# Altium schematic sheet Ext_GPIO_Bank2.SchDoc
size A3
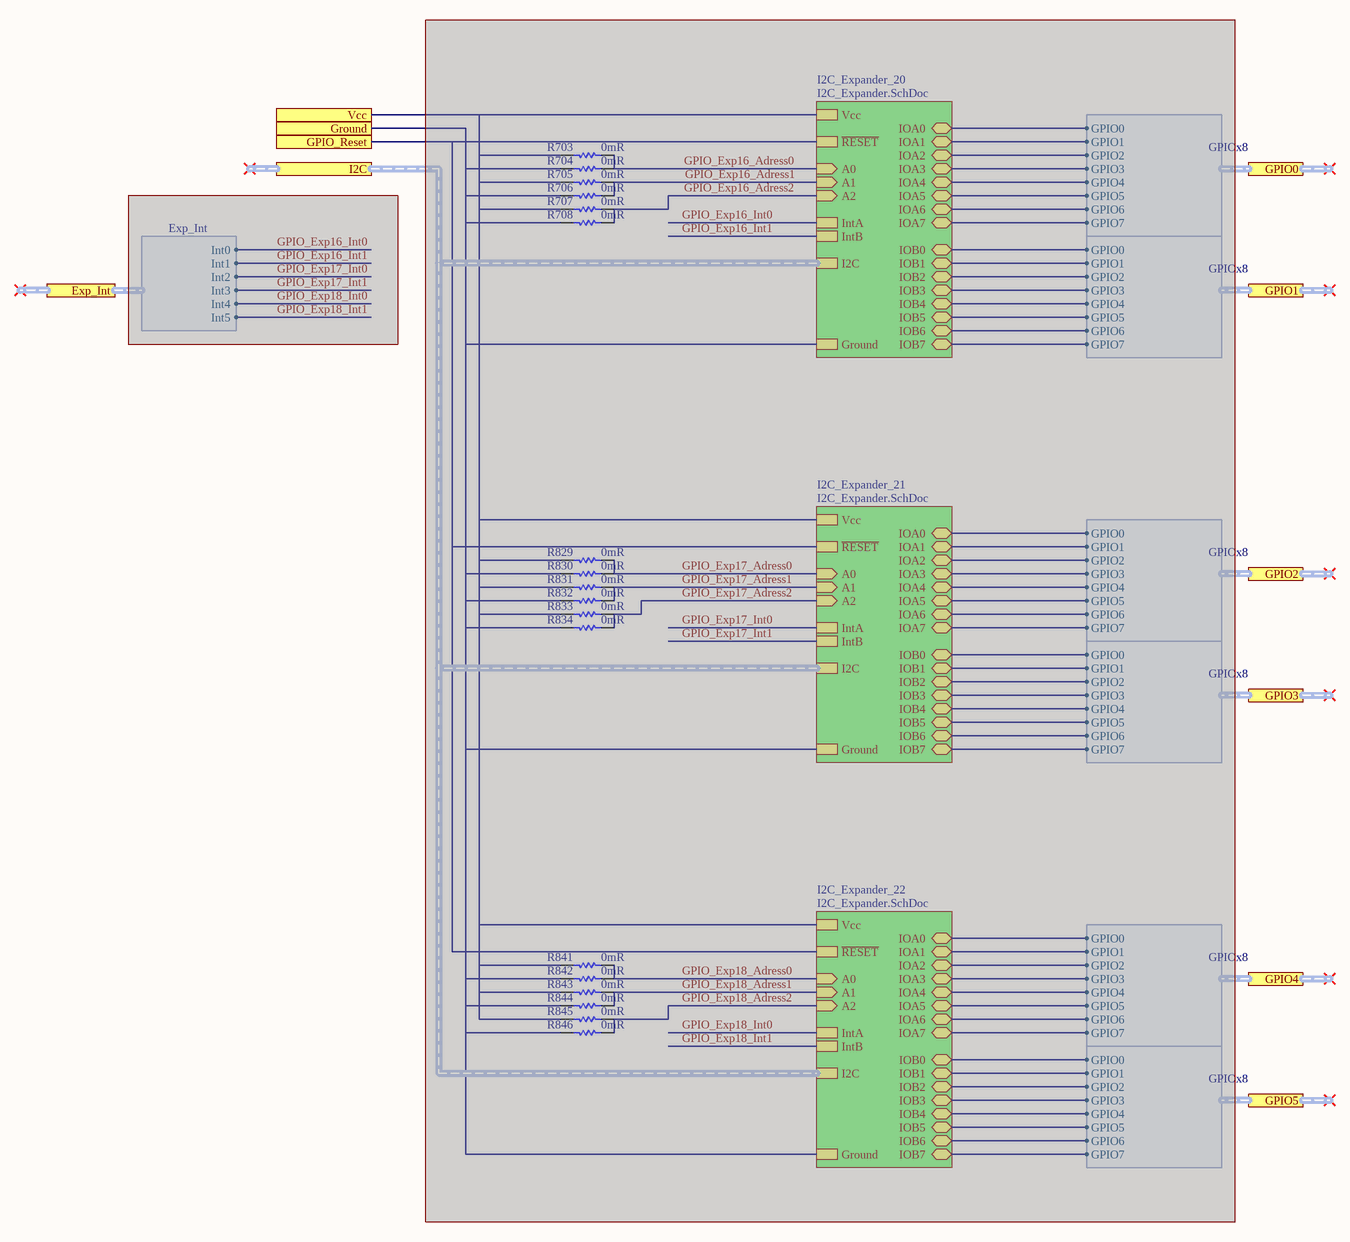
[diagram p0: Ext_GPIO_Bank2.SchDoc]

## Parts
R703  0mR  [RES 0402/1005 RF KK]  (masked out: inside a compile mask, not in the netlist)
R704  0mR  [RES 0402/1005 RF KK]  (masked out: inside a compile mask, not in the netlist)
R705  0mR  [RES 0402/1005 RF KK]  (masked out: inside a compile mask, not in the netlist)
R706  0mR  [RES 0402/1005 RF KK]  (masked out: inside a compile mask, not in the netlist)
R707  0mR  [RES 0402/1005 RF KK]  (masked out: inside a compile mask, not in the netlist)
R708  0mR  [RES 0402/1005 RF KK]  (masked out: inside a compile mask, not in the netlist)
R829  0mR  [RES 0402/1005 RF KK]  (masked out: inside a compile mask, not in the netlist)
R830  0mR  [RES 0402/1005 RF KK]  (masked out: inside a compile mask, not in the netlist)
R831  0mR  [RES 0402/1005 RF KK]  (masked out: inside a compile mask, not in the netlist)
R832  0mR  [RES 0402/1005 RF KK]  (masked out: inside a compile mask, not in the netlist)
R833  0mR  [RES 0402/1005 RF KK]  (masked out: inside a compile mask, not in the netlist)
R834  0mR  [RES 0402/1005 RF KK]  (masked out: inside a compile mask, not in the netlist)
R841  0mR  [RES 0402/1005 RF KK]  (masked out: inside a compile mask, not in the netlist)
R842  0mR  [RES 0402/1005 RF KK]  (masked out: inside a compile mask, not in the netlist)
R843  0mR  [RES 0402/1005 RF KK]  (masked out: inside a compile mask, not in the netlist)
R844  0mR  [RES 0402/1005 RF KK]  (masked out: inside a compile mask, not in the netlist)
R845  0mR  [RES 0402/1005 RF KK]  (masked out: inside a compile mask, not in the netlist)
R846  0mR  [RES 0402/1005 RF KK]  (masked out: inside a compile mask, not in the netlist)

## Sub-sheets
I2C_Expander_20 = I2C_Expander.SchDoc (masked out): IOA7 (bidir), IOA3 (bidir), IOA6 (bidir), IOA1 (bidir), IOA0 (bidir), IOA5 (bidir), IOB1 (bidir), IOB2 (bidir), IOB5 (bidir), IOB6 (bidir), IOB7 (bidir), IntA, IntB, Ground, IOB4 (bidir), IOB3 (bidir), IOA2 (bidir), IOA4 (bidir), IOB0 (bidir), Vcc, ~{RESET}, I2C (harness I2C), A2 (in), A1 (in), A0 (in)
I2C_Expander_21 = I2C_Expander.SchDoc (masked out): IOA7 (bidir), IOA3 (bidir), IOA6 (bidir), IOA1 (bidir), IOA0 (bidir), IOA5 (bidir), IOB1 (bidir), IOB2 (bidir), IOB5 (bidir), IOB6 (bidir), IOB7 (bidir), IntA, IntB, Ground, IOB4 (bidir), IOB3 (bidir), IOA2 (bidir), IOA4 (bidir), IOB0 (bidir), Vcc, ~{RESET}, I2C (harness I2C), A2 (in), A1 (in), A0 (in)
I2C_Expander_22 = I2C_Expander.SchDoc (masked out): IOA7 (bidir), IOA3 (bidir), IOA6 (bidir), IOA1 (bidir), IOA0 (bidir), IOA5 (bidir), IOB1 (bidir), IOB2 (bidir), IOB5 (bidir), IOB6 (bidir), IOB7 (bidir), IntA, IntB, Ground, IOB4 (bidir), IOB3 (bidir), IOA2 (bidir), IOA4 (bidir), IOB0 (bidir), Vcc, ~{RESET}, I2C (harness I2C), A2 (in), A1 (in), A0 (in)

## Ports
Exp_Int (harness Exp_Int), GPIO0 (harness GPIOx8), GPIO1 (harness GPIOx8), GPIO2 (harness GPIOx8), GPIO3 (harness GPIOx8), GPIO4 (harness GPIOx8), GPIO5 (harness GPIOx8), GPIO_Reset, Ground, I2C (harness I2C), Vcc

## Harnesses
GPIOx8: GPIO0, GPIO1, GPIO2, GPIO3, GPIO4, GPIO5, GPIO6, GPIO7
Exp_Int: Int0, Int1, Int2, Int3, Int4, Int5

## Notes on the sheet
- Title
- Size:
- Date:
- A3
- Number:
- Time:
- Revision:
- Sheet
- of
- File:

## Library data of the parts
R703-R708 R829-R834 R841-R846 = Resistor: Manufacturer 1: Yageo; Manufacturer Part Number 1: RC0402JR-070RL; Power Rating: 62.5mW; Tolerance: 5%; Voltage Rating: 50V; Max Power Dissipation: 63mW; Temperature Coefficient: 200ppm/°C; Supplier 1: Digi-Key; Supplier Part Number 1: 311-0.0JRCT-ND; Stock 1: 69822252; Pricing 1: 1=0.10000, 10=0.01200, 25=0.00920, 50=0.00680, 100=0.00510, 250=0.00388, 500=0.00308, 1000=0.00227, 5000=0.00163 (USD); RoHS: Yes; Case/Package: 0402; Contact Plating: Tin,Matte; Case Code (Metric): 1005; Case Code (Imperial): 0402; Min Operating Temperature: -55°C; Max Operating Temperature: 155°C; Resistance: 0mR; Packaging: Tape and Reel; Composition: Thick Film; Package Quantity: 1; Number of Terminations: 2; Termination: SMD/SMT; Military Standard: Not; Features: Moisture Resistant; Length: 1mm; Height: 0.016inch; Width: 0.02inch; Depth: 0.5mm; Radiation Hardening: No; REACH SVHC: Unknown; Lead Free: Lead Free; ComponentLink1URL: https://datasheet.ciiva.com/2452/pyu-rc0402-51-rohs-l-6-2452608.pdf?src-supplier=Digi-Key; ComponentLink1Description: https://datasheet.ciiva.com/2452/pyu-rc0402-51-rohs-l-6-2452608.pdf?src-supplier=Digi-Key; ComponentLink2URL: https://datasheet.ciiva.com/11808/0900766b80c66297-11808195.pdf?src-supplier=RSComponents; ComponentLink2Description: https://datasheet.ciiva.com/11808/0900766b80c66297-11808195.pdf?src-supplier=RSComponents; ComponentLink3URL: https://datasheet.ciiva.com/2452/pyu-r-int-thick-7-2452609.pdf?src-supplier=Digi-Key; ComponentLink3Description: https://datasheet.ciiva.com/2452/pyu-r-int-thick-7-2452609.pdf?src-supplier=Digi-Key; ComponentLink4URL: https://datasheet.ciiva.com/22747/1018594-22747515.pdf?src-supplier=Element14; ComponentLink4Description: https://datasheet.ciiva.com/22747/1018594-22747515.pdf?src-supplier=Element14; ComponentLink5URL: https://datasheet.ciiva.com/7983/1018594-7983535.pdf?src-supplier=Element14; ComponentLink5Description: https://datasheet.ciiva.com/7983/1018594-7983535.pdf?src-supplier=Element14; ComponentLink6URL: https://datasheet.ciiva.com/2452/pyu-r-int-thick-7-2452610.pdf?src-supplier=Digi-Key; ComponentLink6Description: https://datasheet.ciiva.com/2452/pyu-r-int-thick-7-2452610.pdf?src-supplier=Digi-Key; ComponentLink7URL: https://datasheet.ciiva.com/8896/pyu-rc0402-51-rohs-l-6-8896201.pdf?src-supplier=Avnet; ComponentLink7Description: https://datasheet.ciiva.com/8896/pyu-rc0402-51-rohs-l-6-8896201.pdf?src-supplier=Avnet; ComponentLink8URL: https://datasheet.ciiva.com/28386/pyu-rc0402-51-rohs-l-6-28386633.pdf?src-supplier=Avnet+Europe; ComponentLink8Description: https://datasheet.ciiva.com/28386/pyu-rc0402-51-rohs-l-6-28386633.pdf?src-supplier=Avnet+Europe; ComponentLink9URL: https://datasheet.ciiva.com/15189/getdatasheetpartid-326379-15189533.pdf?src-supplier=Verical; ComponentLink9Description: https://datasheet.ciiva.com/15189/getdatasheetpartid-326379-15189533.pdf?src-supplier=Verical